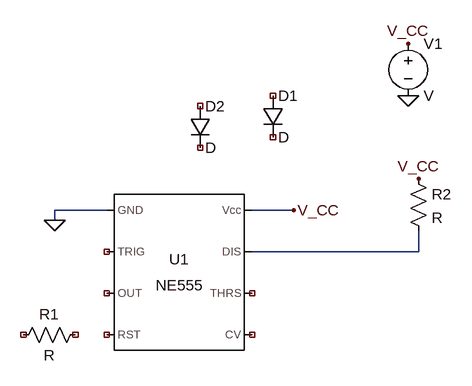
[diagram p0: schematic 555.asc]
555.asc, the LTspice schematic file:
Version 4.1
SHEET 1 880 680
WIRE 48 64 -32 64
WIRE 336 64 272 64
WIRE -32 80 -32 64
WIRE 528 128 528 96
WIRE 528 128 272 128
FLAG -32 80 0
FLAG 512 -112 0
FLAG 512 -192 V_CC
FLAG 336 64 V_CC
FLAG 528 16 V_CC
SYMBOL Misc\\NE555 160 160 R0
SYMATTR InstName U1
SYMBOL voltage 512 -208 R0
SYMATTR InstName V1
SYMBOL res 16 240 R90
WINDOW 0 0 56 VBottom 2
WINDOW 3 32 56 VTop 2
SYMATTR InstName R1
SYMBOL res 512 0 R0
SYMATTR InstName R2
SYMBOL diode 288 -112 R0
SYMATTR InstName D1
SYMBOL diode 176 -96 R0
SYMATTR InstName D2

The netlist it stands for:
* 555.asc
X§U1 0 NC_01 NC_02 NC_03 NC_04 NC_05 N001 V_CC NE555  ; pins GND TRIG OUT RST CV THRS DIS Vcc
V1 V_CC 0 V
R1 NC_06 NC_07 R
R2 V_CC N001 R
D1 NC_08 NC_09 D
D2 NC_10 NC_11 D
.model D D
.lib standard.dio
.lib NE555.sub
.backanno
.end